# Altium schematic sheet A.SchDoc
size A4
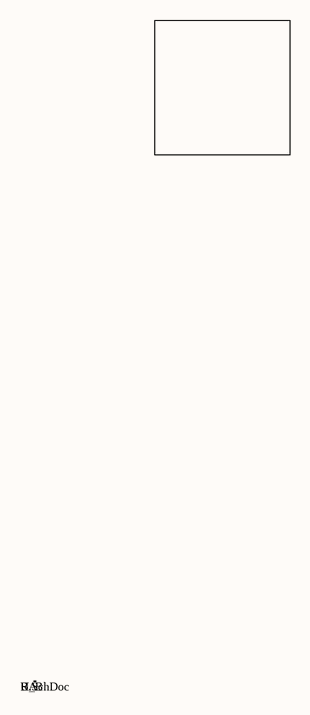
[diagram p0: A.SchDoc]

## Parts
RA  (no value)

## Sub-sheets
U_B = B.SchDoc: no entries

## Nets

Not connected (* = marked no-connect by the designer): RA 1(A)

## Library data of the parts
RA = RES